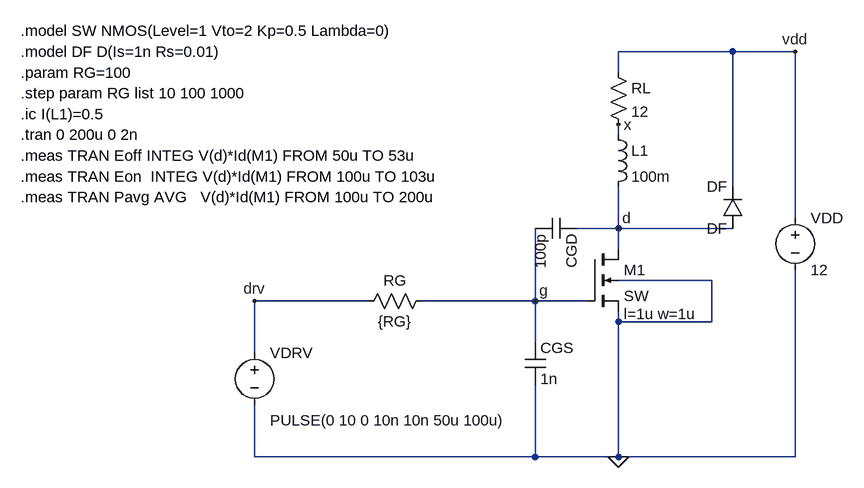
[diagram p0: schematic Adv02.asc]
Adv02.asc, the LTspice schematic file:
Version 4.1
SHEET 1 1200 800
WIRE 416 -304 240 -304
WIRE 512 -304 416 -304
WIRE 240 -272 240 -304
WIRE 240 -176 240 -192
WIRE 416 -96 416 -304
WIRE 512 -48 512 -304
WIRE 240 -32 240 -96
WIRE 240 -32 176 -32
WIRE 416 -32 240 -32
WIRE 240 0 240 -32
WIRE 384 48 240 48
WIRE -144 80 -320 80
WIRE 112 80 112 -32
WIRE 112 80 -64 80
WIRE 192 80 112 80
WIRE 240 112 240 96
WIRE 384 112 384 48
WIRE 384 112 240 112
WIRE 112 144 112 80
WIRE -320 160 -320 80
WIRE -320 320 -320 240
WIRE 112 320 112 208
WIRE 112 320 -320 320
WIRE 240 320 240 112
WIRE 240 320 112 320
WIRE 512 320 512 32
WIRE 512 320 240 320
FLAG 240 320 0
FLAG 240 -32 d
FLAG 112 80 g
FLAG -320 80 drv
FLAG 240 -192 x
FLAG 512 -304 vdd
SYMBOL nmos4 192 0 R0
WINDOW 39 56 100 Left 2
SYMATTR SpiceLine l=1u w=1u
SYMATTR InstName M1
SYMATTR Value SW
SYMBOL res 224 -288 R0
SYMATTR InstName RL
SYMATTR Value 12
SYMBOL ind 224 -192 R0
SYMATTR InstName L1
SYMATTR Value 100m
SYMBOL diode 432 -32 R180
SYMATTR InstName DF
SYMATTR Value DF
SYMBOL voltage 512 -64 R0
SYMATTR InstName VDD
SYMATTR Value 12
SYMBOL voltage -320 144 R0
WINDOW 123 0 0 Left 0
WINDOW 39 0 0 Left 0
WINDOW 3 24 120 Left 2
SYMATTR Value PULSE(0 10 0 10n 10n 50u 100u)
SYMATTR InstName VDRV
SYMBOL res -48 64 R90
WINDOW 0 0 56 VBottom 2
WINDOW 3 32 56 VTop 2
SYMATTR InstName RG
SYMATTR Value {RG}
SYMBOL cap 96 144 R0
SYMATTR InstName CGS
SYMATTR Value 1n
SYMBOL cap 176 -48 R90
SYMATTR InstName CGD
SYMATTR Value 100p
TEXT -680 -336 Left 2 !.model SW NMOS(Level=1 Vto=2 Kp=0.5 Lambda=0)
TEXT -680 -304 Left 2 !.model DF D(Is=1n Rs=0.01)
TEXT -680 -272 Left 2 !.param RG=100
TEXT -680 -240 Left 2 !.step param RG list 10 100 1000
TEXT -680 -208 Left 2 !.ic I(L1)=0.5
TEXT -680 -176 Left 2 !.tran 0 200u 0 2n
TEXT -680 -144 Left 2 !.meas TRAN Eoff INTEG V(d)*Id(M1) FROM 50u TO 53u
TEXT -680 -112 Left 2 !.meas TRAN Eon  INTEG V(d)*Id(M1) FROM 100u TO 103u
TEXT -680 -80 Left 2 !.meas TRAN Pavg AVG   V(d)*Id(M1) FROM 100u TO 200u

The netlist it stands for:
* Adv02.asc
M1 d g 0 0 SW l=1u w=1u
RL vdd x 12
L1 x d 100m
DF d vdd DF
VDD vdd 0 12
VDRV drv 0 PULSE(0 10 0 10n 10n 50u 100u)
RG g drv {RG}
CGS g 0 1n
CGD d g 100p
.model D D
.lib standard.dio
.model NMOS NMOS
.model PMOS PMOS
.lib standard.mos
.model SW NMOS(Level=1 Vto=2 Kp=0.5 Lambda=0)
.model DF D(Is=1n Rs=0.01)
.param RG=100
.step param RG list 10 100 1000
.ic I(L1)=0.5
.tran 0 200u 0 2n
.meas TRAN Eoff INTEG V(d)*Id(M1) FROM 50u TO 53u
.meas TRAN Eon  INTEG V(d)*Id(M1) FROM 100u TO 103u
.meas TRAN Pavg AVG   V(d)*Id(M1) FROM 100u TO 200u
.backanno
.end